# Altium project imx6ull_core.PrjPcb
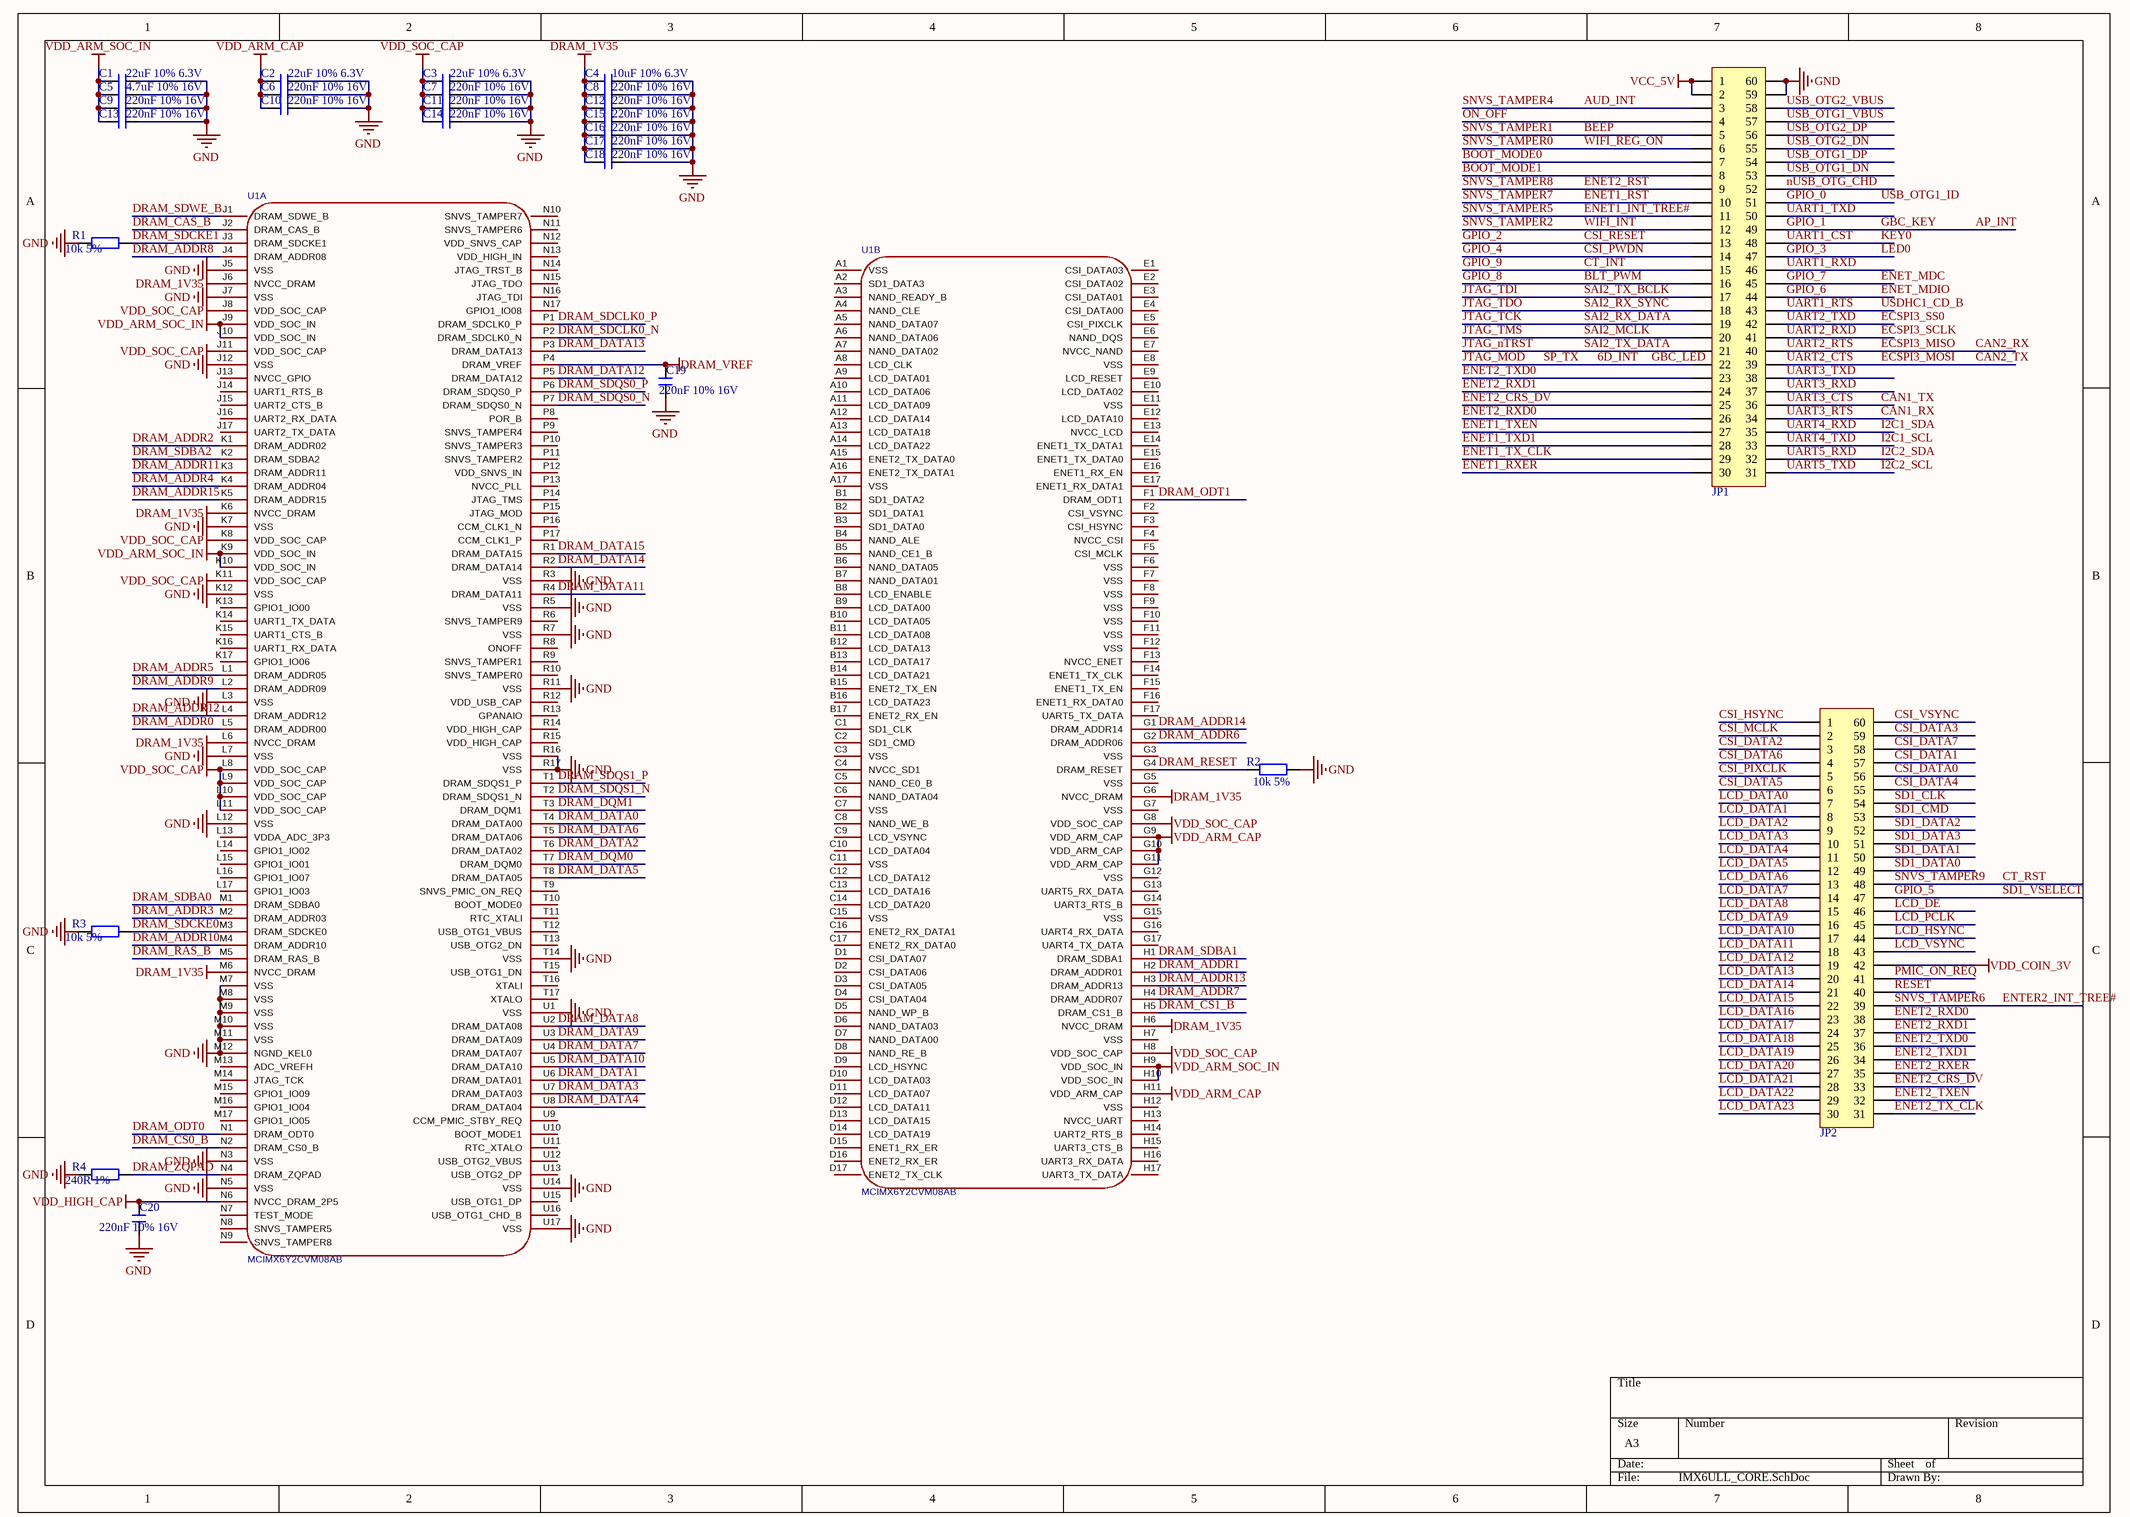
[diagram p0: IMX6ULL_CORE.SchDoc]
3 sheets, 92 parts. Net scope: global (net labels, ports and power ports of the same name join across sheets).
Sheets:
  IMX6ULL_CORE.SchDoc
  POWER.SchDoc
  DDR.SchDoc

## Sheet IMX6ULL_CORE.SchDoc
size A3; SheetNumber: 1; SheetTotal: 3

### Parts
C1  22uF 10% 6.3V  [C0603_L]
C2  22uF 10% 6.3V  [C0603_L]
C3  22uF 10% 6.3V  [C0603_L]
C4  10uF 10% 6.3V  [C0603_L]
C5  4.7uF 10% 16V  [C0603_L]
C6  220nF 10% 16V  [C0603_L]
C7  220nF 10% 16V  [C0603_L]
C8  220nF 10% 16V  [C0603_L]
C9  220nF 10% 16V  [C0603_L]
C10  220nF 10% 16V  [C0603_L]
C11  220nF 10% 16V  [C0603_L]
C12  220nF 10% 16V  [C0603_L]
C13  220nF 10% 16V  [C0603_L]
C14  220nF 10% 16V  [C0603_L]
C15  220nF 10% 16V  [C0603_L]
C16  220nF 10% 16V  [C0603_L]
C17  220nF 10% 16V  [C0603_L]
C18  220nF 10% 16V  [C0603_L]
C19  220nF 10% 16V  [C0603_L]
C20  220nF 10% 16V  [C0603_L]
JP1  Header 2X30  [IDC2.54-LI-2x30P]  (value not drawn)
JP2  Header 2X30  [IDC2.54-LI-2x30P]  (value not drawn)
R1  10k 5%  [R0603_L]
R2  10k 5%  [R0603_L]
R3  10k 5%  [R0603_L]
R4  240R 1%  [R0603_L]
U1  MCIMX6Y2CVM08AB  [BGA-289_L14.0-W14.0-R17-C17-P0.80-BL]  (parts A,B of 2)

### Nets
DRAM_1V35: C4.1 C8.1 C12.1 C15.1 C16.1 C17.1 C18.1 U1.G6(NVCC_DRAM) U1.H6(NVCC_DRAM) U1.J6(NVCC_DRAM) U1.K6(NVCC_DRAM) U1.L6(NVCC_DRAM) U1.M6(NVCC_DRAM)
DRAM_VREF: C19.2 U1.P4(DRAM_VREF)
GND: C1.2 C2.2 C3.2 C4.2 C5.2 C6.2 C7.2 C8.2 C9.2 C10.2 C11.2 C12.2 C13.2 C14.2 C15.2 C16.2 C17.2 C18.2 C19.1 C20.1 JP1.59 JP1.60 R1.1 R2.2 R3.1 R4.1 U1.J5(VSS) U1.J7(VSS) U1.J12(VSS) U1.K7(VSS) U1.K12(VSS) U1.L3(VSS) U1.L7(VSS) U1.L12(VSS) U1.M7(VSS) U1.M8(VSS) U1.M9(VSS) U1.M10(VSS) U1.M11(VSS) U1.M12(NGND_KEL0) U1.N3(VSS) U1.N5(VSS) U1.R3(VSS) U1.R5(VSS) U1.R7(VSS) U1.R11(VSS) U1.R16(VSS) U1.R17(VSS) U1.T14(VSS) U1.U1(VSS) U1.U14(VSS) U1.U17(VSS)
VCC_5V: JP1.1 JP1.2
VDD_ARM_CAP: C2.1 C6.1 C10.1 U1.G9(VDD_ARM_CAP) U1.G10(VDD_ARM_CAP) U1.G11(VDD_ARM_CAP) U1.H11(VDD_ARM_CAP)
VDD_ARM_SOC_IN: C1.1 C5.1 C9.1 C13.1 U1.H9(VDD_SOC_IN) U1.H10(VDD_SOC_IN) U1.J9(VDD_SOC_IN) U1.J10(VDD_SOC_IN) U1.K9(VDD_SOC_IN) U1.K10(VDD_SOC_IN)
VDD_COIN_3V: JP2.42
VDD_HIGH_CAP: C20.2 U1.N6(NVCC_DRAM_2P5)
VDD_SOC_CAP: C3.1 C7.1 C11.1 C14.1 U1.G8(VDD_SOC_CAP) U1.H8(VDD_SOC_CAP) U1.J8(VDD_SOC_CAP) U1.J11(VDD_SOC_CAP) U1.K8(VDD_SOC_CAP) U1.K11(VDD_SOC_CAP) U1.L8(VDD_SOC_CAP) U1.L9(VDD_SOC_CAP) U1.L10(VDD_SOC_CAP) U1.L11(VDD_SOC_CAP)
6D_INT: JP1.22  [also labelled GBC_LED, JTAG_MOD, SP_TX]
AP_INT: JP1.49  [also labelled GBC_KEY, GPIO_1]
AUD_INT: JP1.3  [also labelled SNVS_TAMPER4]
BEEP: JP1.5  [also labelled SNVS_TAMPER1]
BLT_PWM: JP1.16  [also labelled GPIO_8]
BOOT_MODE0: JP1.7
BOOT_MODE1: JP1.8
CAN1_RX: JP1.34  [also labelled UART3_RTS]
CAN1_TX: JP1.36  [also labelled UART3_CTS]
CAN2_RX: JP1.40  [also labelled ECSPI3_MISO, UART2_RTS]
CAN2_TX: JP1.39  [also labelled ECSPI3_MOSI, UART2_CTS]
CSI_DATA0: JP2.56
CSI_DATA1: JP2.57
CSI_DATA2: JP2.3
CSI_DATA3: JP2.59
CSI_DATA4: JP2.55
CSI_DATA5: JP2.6
CSI_DATA6: JP2.4
CSI_DATA7: JP2.58
CSI_HSYNC: JP2.1
CSI_MCLK: JP2.2
CSI_PIXCLK: JP2.5
CSI_PWDN: JP1.14  [also labelled GPIO_4]
CSI_RESET: JP1.13  [also labelled GPIO_2]
CSI_VSYNC: JP2.60
CT_INT: JP1.15  [also labelled GPIO_9]
CT_RST: JP2.48  [also labelled SNVS_TAMPER9]
DRAM_ADDR0: U1.L5(DRAM_ADDR00)
DRAM_ADDR1: U1.H2(DRAM_ADDR01)
DRAM_ADDR2: U1.K1(DRAM_ADDR02)
DRAM_ADDR3: U1.M2(DRAM_ADDR03)
DRAM_ADDR4: U1.K4(DRAM_ADDR04)
DRAM_ADDR5: U1.L1(DRAM_ADDR05)
DRAM_ADDR6: U1.G2(DRAM_ADDR06)
DRAM_ADDR7: U1.H4(DRAM_ADDR07)
DRAM_ADDR8: U1.J4(DRAM_ADDR08)
DRAM_ADDR9: U1.L2(DRAM_ADDR09)
DRAM_ADDR10: U1.M4(DRAM_ADDR10)
DRAM_ADDR11: U1.K3(DRAM_ADDR11)
DRAM_ADDR12: U1.L4(DRAM_ADDR12)
DRAM_ADDR13: U1.H3(DRAM_ADDR13)
DRAM_ADDR14: U1.G1(DRAM_ADDR14)
DRAM_ADDR15: U1.K5(DRAM_ADDR15)
DRAM_CAS_B: U1.J2(DRAM_CAS_B)
DRAM_CS0_B: U1.N2(DRAM_CS0_B)
DRAM_CS1_B: U1.H5(DRAM_CS1_B)
DRAM_DATA0: U1.T4(DRAM_DATA00)
DRAM_DATA1: U1.U6(DRAM_DATA01)
DRAM_DATA2: U1.T6(DRAM_DATA02)
DRAM_DATA3: U1.U7(DRAM_DATA03)
DRAM_DATA4: U1.U8(DRAM_DATA04)
DRAM_DATA5: U1.T8(DRAM_DATA05)
DRAM_DATA6: U1.T5(DRAM_DATA06)
DRAM_DATA7: U1.U4(DRAM_DATA07)
DRAM_DATA8: U1.U2(DRAM_DATA08)
DRAM_DATA9: U1.U3(DRAM_DATA09)
DRAM_DATA10: U1.U5(DRAM_DATA10)
DRAM_DATA11: U1.R4(DRAM_DATA11)
DRAM_DATA12: U1.P5(DRAM_DATA12)
DRAM_DATA13: U1.P3(DRAM_DATA13)
DRAM_DATA14: U1.R2(DRAM_DATA14)
DRAM_DATA15: U1.R1(DRAM_DATA15)
DRAM_DQM0: U1.T7(DRAM_DQM0)
DRAM_DQM1: U1.T3(DRAM_DQM1)
DRAM_ODT0: U1.N1(DRAM_ODT0)
DRAM_ODT1: U1.F1(DRAM_ODT1)
DRAM_RAS_B: U1.M5(DRAM_RAS_B)
DRAM_RESET: R2.1 U1.G4(DRAM_RESET)
DRAM_SDBA0: U1.M1(DRAM_SDBA0)
DRAM_SDBA1: U1.H1(DRAM_SDBA1)
DRAM_SDBA2: U1.K2(DRAM_SDBA2)
DRAM_SDCKE0: R3.2 U1.M3(DRAM_SDCKE0)
DRAM_SDCKE1: R1.2 U1.J3(DRAM_SDCKE1)
DRAM_SDCLK0_N: U1.P2(DRAM_SDCLK0_N)
DRAM_SDCLK0_P: U1.P1(DRAM_SDCLK0_P)
DRAM_SDQS0_N: U1.P7(DRAM_SDQS0_N)
DRAM_SDQS0_P: U1.P6(DRAM_SDQS0_P)
DRAM_SDQS1_N: U1.T2(DRAM_SDQS1_N)
DRAM_SDQS1_P: U1.T1(DRAM_SDQS1_P)
DRAM_SDWE_B: U1.J1(DRAM_SDWE_B)
DRAM_ZQPAD: R4.2 U1.N4(DRAM_ZQPAD)
ECSPI3_SCLK: JP1.41  [also labelled UART2_RXD]
ECSPI3_SS0: JP1.42  [also labelled UART2_TXD]
ENET1_INT_TREE#: JP1.11  [also labelled SNVS_TAMPER5]
ENET1_RST: JP1.10  [also labelled SNVS_TAMPER7]
ENET1_RXER: JP1.30
ENET1_TX_CLK: JP1.29
ENET1_TXD1: JP1.28
ENET1_TXEN: JP1.27
ENET2_CRS_DV: JP1.25 JP2.33
ENET2_RST: JP1.9  [also labelled SNVS_TAMPER8]
ENET2_RXD0: JP1.26 JP2.38
ENET2_RXD1: JP1.24 JP2.37
ENET2_RXER: JP2.35
ENET2_TX_CLK: JP2.31
ENET2_TXD0: JP1.23 JP2.36
ENET2_TXD1: JP2.34
ENET2_TXEN: JP2.32
ENET_MDC: JP1.45  [also labelled GPIO_7]
ENET_MDIO: JP1.44  [also labelled GPIO_6]
ENTER2_INT_TREE#: JP2.39  [also labelled SNVS_TAMPER6]
GPIO_0: JP1.51  [also labelled USB_OTG1_ID]
GPIO_3: JP1.47  [also labelled LED0]
GPIO_5: JP2.47  [also labelled SD1_VSELECT]
I2C1_SCL: JP1.33  [also labelled UART4_TXD]
I2C1_SDA: JP1.35  [also labelled UART4_RXD]
I2C2_SCL: JP1.31  [also labelled UART5_TXD]
I2C2_SDA: JP1.32  [also labelled UART5_RXD]
JTAG_nTRST: JP1.21  [also labelled SAI2_TX_DATA]
JTAG_TCK: JP1.19  [also labelled SAI2_RX_DATA]
JTAG_TDI: JP1.17  [also labelled SAI2_TX_BCLK]
JTAG_TDO: JP1.18  [also labelled SAI2_RX_SYNC]
JTAG_TMS: JP1.20  [also labelled SAI2_MCLK]
KEY0: JP1.48  [also labelled UART1_CST]
LCD_DATA0: JP2.7
LCD_DATA1: JP2.8
LCD_DATA2: JP2.9
LCD_DATA3: JP2.10
LCD_DATA4: JP2.11
LCD_DATA5: JP2.12
LCD_DATA6: JP2.13
LCD_DATA7: JP2.14
LCD_DATA8: JP2.15
LCD_DATA9: JP2.16
LCD_DATA10: JP2.17
LCD_DATA11: JP2.18
LCD_DATA12: JP2.19
LCD_DATA13: JP2.20
LCD_DATA14: JP2.21
LCD_DATA15: JP2.22
LCD_DATA16: JP2.23
LCD_DATA17: JP2.24
LCD_DATA18: JP2.25
LCD_DATA19: JP2.26
LCD_DATA20: JP2.27
LCD_DATA21: JP2.28
LCD_DATA22: JP2.29
LCD_DATA23: JP2.30
LCD_DE: JP2.46
LCD_HSYNC: JP2.44
LCD_PCLK: JP2.45
LCD_VSYNC: JP2.43
nUSB_OTG_CHD: JP1.52
ON_OFF: JP1.4
PMIC_ON_REQ: JP2.41
RESET: JP2.40
SD1_CLK: JP2.54
SD1_CMD: JP2.53
SD1_DATA0: JP2.49
SD1_DATA1: JP2.50
SD1_DATA2: JP2.52
SD1_DATA3: JP2.51
SNVS_TAMPER0: JP1.6  [also labelled WIFI_REG_ON]
SNVS_TAMPER2: JP1.12  [also labelled WIFI_INT]
UART1_RTS: JP1.43  [also labelled USDHC1_CD_B]
UART1_RXD: JP1.46
UART1_TXD: JP1.50
UART3_RXD: JP1.37
UART3_TXD: JP1.38
USB_OTG1_DN: JP1.53
USB_OTG1_DP: JP1.54
USB_OTG1_VBUS: JP1.57
USB_OTG2_DN: JP1.55
USB_OTG2_DP: JP1.56
USB_OTG2_VBUS: JP1.58

Not connected (* = marked no-connect by the designer): U1 A1(VSS) A2(SD1_DATA3) A3(NAND_READY_B) A4(NAND_CLE) A5(NAND_DATA07) A6(NAND_DATA06) A7(NAND_DATA02) A8(LCD_CLK) A9(LCD_DATA01) A10(LCD_DATA06) A11(LCD_DATA09) A12(LCD_DATA14) A13(LCD_DATA18) A14(LCD_DATA22) A15(ENET2_TX_DATA0) A16(ENET2_TX_DATA1) A17(VSS) B1(SD1_DATA2) B2(SD1_DATA1) B3(SD1_DATA0) B4(NAND_ALE) B5(NAND_CE1_B) B6(NAND_DATA05) B7(NAND_DATA01) B8(LCD_ENABLE) B9(LCD_DATA00) B10(LCD_DATA05) B11(LCD_DATA08) B12(LCD_DATA13) B13(LCD_DATA17) B14(LCD_DATA21) B15(ENET2_TX_EN) B16(LCD_DATA23) B17(ENET2_RX_EN) C1(SD1_CLK) C2(SD1_CMD) C3(VSS) C4(NVCC_SD1) C5(NAND_CE0_B) C6(NAND_DATA04) C7(VSS) C8(NAND_WE_B) C9(LCD_VSYNC) C10(LCD_DATA04) C11(VSS) C12(LCD_DATA12) C13(LCD_DATA16) C14(LCD_DATA20) C15(VSS) C16(ENET2_RX_DATA1) C17(ENET2_RX_DATA0) D1(CSI_DATA07) D2(CSI_DATA06) D3(CSI_DATA05) D4(CSI_DATA04) D5(NAND_WP_B) D6(NAND_DATA03) D7(NAND_DATA00) D8(NAND_RE_B) D9(LCD_HSYNC) D10(LCD_DATA03) D11(LCD_DATA07) D12(LCD_DATA11) D13(LCD_DATA15) D14(LCD_DATA19) D15(ENET1_RX_ER) D16(ENET2_RX_ER) D17(ENET2_TX_CLK) E1(CSI_DATA03) E2(CSI_DATA02) E3(CSI_DATA01) E4(CSI_DATA00) E5(CSI_PIXCLK) E6(NAND_DQS) E7(NVCC_NAND) E8(VSS) E9(LCD_RESET) E10(LCD_DATA02) E11(VSS) E12(LCD_DATA10) E13(NVCC_LCD) E14(ENET1_TX_DATA1) E15(ENET1_TX_DATA0) E16(ENET1_RX_EN) E17(ENET1_RX_DATA1) F2(CSI_VSYNC) F3(CSI_HSYNC) F4(NVCC_CSI) F5(CSI_MCLK) F6(VSS) F7(VSS) F8(VSS) F9(VSS) F10(VSS) F11(VSS) F12(VSS) F13(NVCC_ENET) F14(ENET1_TX_CLK) F15(ENET1_TX_EN) F16(ENET1_RX_DATA0) F17(UART5_TX_DATA) G3(VSS) G5(VSS) G7(VSS) G12(VSS) G13(UART5_RX_DATA) G14(UART3_RTS_B) G15(VSS) G16(UART4_RX_DATA) G17(UART4_TX_DATA) H7(VSS) H12(VSS) H13(NVCC_UART) H14(UART2_RTS_B) H15(UART3_CTS_B) H16(UART3_RX_DATA) H17(UART3_TX_DATA) J13(NVCC_GPIO) J14(UART1_RTS_B) J15(UART2_CTS_B) J16(UART2_RX_DATA) J17(UART2_TX_DATA) K13(GPIO1_IO00) K14(UART1_TX_DATA) K15(UART1_CTS_B) K16(UART1_RX_DATA) K17(GPIO1_IO06) L13(VDDA_ADC_3P3) L14(GPIO1_IO02) L15(GPIO1_IO01) L16(GPIO1_IO07) L17(GPIO1_IO03) M13(ADC_VREFH) M14(JTAG_TCK) M15(GPIO1_IO09) M16(GPIO1_IO04) M17(GPIO1_IO05) N7(TEST_MODE) N8(SNVS_TAMPER5) N9(SNVS_TAMPER8) N10(SNVS_TAMPER7) N11(SNVS_TAMPER6) N12(VDD_SNVS_CAP) N13(VDD_HIGH_IN) N14(JTAG_TRST_B) N15(JTAG_TDO) N16(JTAG_TDI) N17(GPIO1_IO08) P8(POR_B) P9(SNVS_TAMPER4) P10(SNVS_TAMPER3) P11(SNVS_TAMPER2) P12(VDD_SNVS_IN) P13(NVCC_PLL) P14(JTAG_TMS) P15(JTAG_MOD) P16(CCM_CLK1_N) P17(CCM_CLK1_P) R6(SNVS_TAMPER9) R8(ONOFF) R9(SNVS_TAMPER1) R10(SNVS_TAMPER0) R12(VDD_USB_CAP) R13(GPANAIO) R14(VDD_HIGH_CAP) R15(VDD_HIGH_CAP) T9(SNVS_PMIC_ON_REQ) T10(BOOT_MODE0) T11(RTC_XTALI) T12(USB_OTG1_VBUS) T13(USB_OTG2_DN) T15(USB_OTG1_DN) T16(XTALI) T17(XTALO) U9(CCM_PMIC_STBY_REQ) U10(BOOT_MODE1) U11(RTC_XTALO) U12(USB_OTG2_VBUS) U13(USB_OTG2_DP) U15(USB_OTG1_DP) U16(USB_OTG1_CHD_B)

### Library data of the parts
C1-C20 = C: 贴片电容; BOM名称: 无极性贴片电容; 优秀评价可免费更新: 联系淘宝ID：黄晶宝石，获取更新版封装库; 卖家免费技术支持，联系售后: 唯一出售店铺网址https://shop463601444.taobao.com; 本封装库来自淘宝卖家 ID：黄晶宝石: 其他店铺购入均为盗版，请立即申请退款
JP1 JP2 = Header 30X2: 30*2P接插件; BOM名称: 20*2P接插件; 联系卖家，免费查找封装: 唯一出售店铺网址https://shop463601444.taobao.com; 封装库来自淘宝卖家ID：黄晶宝石: 其他店铺购入均为盗版封装库，请立即申请退款，本店现金奖励50~200元
R1-R4 = R: 贴片电阻; 优秀评价可免费更新: 联系淘宝ID：黄晶宝石，获取更新版封装库; 卖家免费技术支持，联系售后: 唯一出售店铺网址https://shop463601444.taobao.com; 本封装库来自淘宝卖家 ID：黄晶宝石: 其他店铺购入均为盗版，请立即申请退款; BOM名称: 贴片电阻
U1 = MCIMX6Y2CVM08AB: CPU内核:ARM Cortex-A7;CPU最大主频:792MHz;CPU位数:32 Bit;; Manufacturer: NXP(恩智浦); Relevance: []; AddInBom: yes; ModelId: a5b4ce0fea5c4f8daaedcc161a7e0fdb聨0819f05c4eef4c71ace90d822a990e87; ModelName: BGA-289_L14.0-W14.0-H1.4-P0.8; ModelTransform: 551.18,551.18,0,90,0,0,1.403,1.408,0; CPU Maximum Speed: 792MHz; Core Size: 32 Bit; Program Storage Size: 128KB; ADC (Bit): 12bit; Voltage - Supply: 1.8V；2.8V；3.3V; Symbol: MCIMX6Y2CVM08AB; Device: MCIMX6Y2CVM08AB; FootprintName: BGA-289_L14.0-W14.0-R17-C17-P0.80-BL; LCSC Part Name: i.MX 6ULL 工业产品应用处理器; SupplierPart: C414042; ManufacturerPart: MCIMX6Y2CVM08AB; Supplier Footprint: MAPBGA-289(14x14); JLCPCB Part Class: Extended Part; Datasheet: https://www.nxp.com/docs/en/data-sheet/IMX6ULLIEC.pdf; Supplier: LCSC; ConvertToPcb: yes; CPU Core: ARM Cortex-A7; RAM Size: 128KB; Operating Temperature: -40℃~+105℃; Features: 窗口看门狗(WWDG)；独立看门狗(IWDG)；日历功能；上电复位(POR)；真随机数发生器(TRNG)；内置通用定时器；内置温度传感器；可编程看门狗；集成LDO

## Sheet POWER.SchDoc
size A4; SheetNumber: 2; SheetTotal: 3
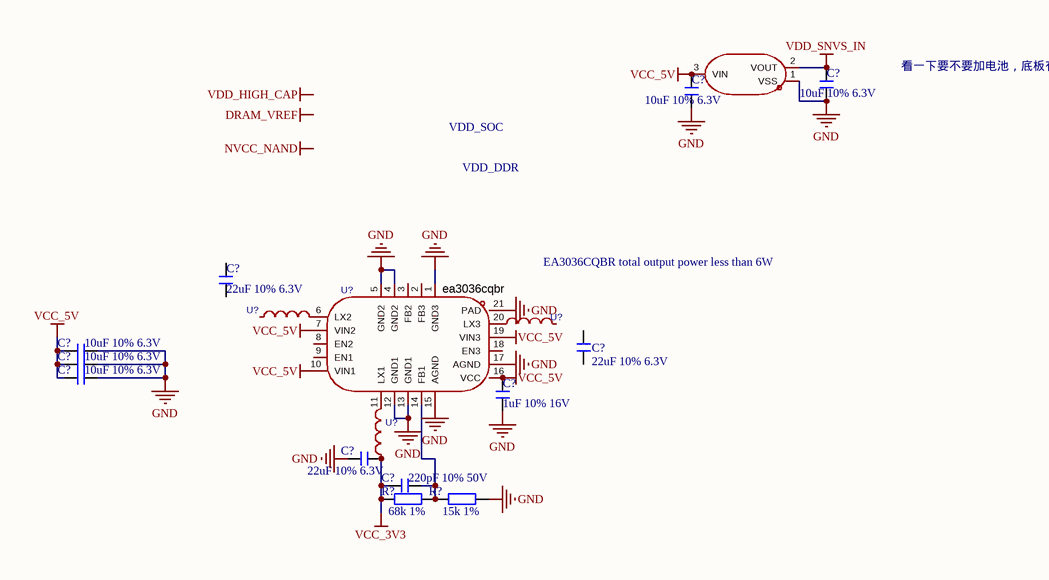
[diagram p1: POWER.SchDoc]

### Parts
(Parts that share a designator on the sheet are numbered #1, #2 ... from top to bottom, then left to right.)
C?#1  10uF 10% 6.3V  [C0402_L]
C?#2  10uF 10% 6.3V  [C0402_L]
C?#3  22uF 10% 6.3V  [C0603_L]
C?#4  22uF 10% 6.3V  [C0603_L]
C?#5  10uF 10% 6.3V  [C0603_L]
C?#6  10uF 10% 6.3V  [C0603_L]
C?#7  10uF 10% 6.3V  [C0603_L]
C?#8  1uF 10% 16V  [C0603_L]
C?#9  22uF 10% 6.3V  [C0603_L]
C?#10  220pF 10% 50V  [C0603_L]
R?#1  68k 1%  [R0603_L]
R?#2  15k 1%  [R0603_L]
U?#1  662k.  [SOT-23-3_L2.9-W1.3-P1.90-LS2.4-BR]  (value not drawn)
U?#2  mwtc252010s2r2mt  [IND-SMD_L2.5-W2.0_AHP252010X]  (value not drawn)
U?#3  mwtc252010s2r2mt  [IND-SMD_L2.5-W2.0_AHP252010X]  (value not drawn)
U?#4  ea3036cqbr  [WQFN-20_L3.0-W3.0-P0.40-BL-EP]
U?#5  mwtc252010s2r2mt  [IND-SMD_L2.5-W2.0_AHP252010X]  (value not drawn)

### Nets
GND: C?#1.1 C?#2.1 C?#5.1 C?#6.1 C?#7.1 C?#8.1 C?#9.1 R?#2.1 U?#1.1(VSS) U?#4.1(GND3) U?#4.4(GND2) U?#4.5(GND2) U?#4.12(GND1) U?#4.13(GND1) U?#4.15(AGND) U?#4.17(AGND) U?#4.21(PAD)
VCC_3V3: C?#9.2 C?#10.1 R?#1.2 U?#5.1
VCC_5V: C?#2.2 C?#5.2 C?#6.2 C?#7.2 C?#8.2 U?#1.3(VIN) U?#4.7(VIN2) U?#4.10(VIN1) U?#4.16(VCC) U?#4.19(VIN3)
VDD_SNVS_IN: C?#1.2 U?#1.2(VOUT)
NetC?#10_2: C?#10.2 R?#1.1 R?#2.2 U?#4.14(FB1)
NetU?#2_2: U?#2.2 U?#4.6(LX2)
NetU?#3_1: U?#3.1 U?#4.20(LX3)
NetU?#4_11: U?#4.11(LX1) U?#5.2

Not connected (* = marked no-connect by the designer): C?#3 1 2; C?#4 1 2; U?#2 1; U?#3 2; U?#4 2(FB3) 3(FB2) 8(EN2) 9(EN1) 18(EN3)

### Notes on the sheet
- 看一下要不要加电池，底板有咩有时钟芯片
- VDD_SOC
- VDD_DDR
- EA3036CQBR total output power less than 6W
- Labels drawn without touching a wire or pin: DRAM_VREF, NVCC_NAND, VDD_HIGH_CAP

### Library data of the parts
C?#1-C?#10 = C: as C1 on sheet IMX6ULL_CORE
R?#1 R?#2 = R: as R1 on sheet IMX6ULL_CORE; BOM名称: 贴片电阻
U?#1 = 662k.: 输出极性:正极;工作电压:6V;输出电压:3.3V;输出电流:300mA;电源纹波抑制比(PSRR):-;输出类型:固定;; Manufacturer: FM(富满); AddInBom: yes; ModelId: c62791f0466c4ae2a892c056b845b0ca; ModelName: SOT-23-3P_L2.9-W1.3-H1.0-LS2.4-P0.95; ModelTransform: 98.425,114.173,0,180,0,0,0.0005,-0.0005,0; Output Configuration: 正极; Voltage - Supply: 6V; Output Voltage: 3.3V; Output Current: 300mA; Voltage Dropout: 40mV@(30mA); standby current: 10uA; Output Type: 固定; Number of Outputs: 1; Symbol: 662K.; LCSC Part Name: 3.3V 300mA 6V; SupplierPart: C841298; ManufacturerPart: 662K.; Supplier Footprint: SOT-23-3; JLCPCB Part Class: Extended Part; Datasheet: https://item.szlcsc.com/datasheet/662K./898173.html; Supplier: LCSC; ConvertToPcb: yes; FootprintName: SOT-23-3_L2.9-W1.3-P1.90-LS2.4-BR; Power Supply Rejection Ratio (PSRR): -; Noise: -; Features: 短路保护; Operating Temperature: -40℃~+130℃@(Tj)
U?#2 U?#3 U?#5 = mwtc252010s2r2mt: 特性：铁合金材料,高通流,低损耗。黑胶热喷,表面致密性更好。闭合磁路设计,漏磁干扰小。应用：智能手机、平板。笔记本电脑、虚拟现实、增强现实; Manufacturer: Sunlord(顺络); AddInBom: yes; ModelId: 367fe49331814287ace6cad199df558f; ModelName: IND-SMD_L2.5-W2.0-H1.2_AHP252010X; ModelTransform: 78.74,98.425,0,90,0,0,0,0,0; Symbol: MWTC252010S2R2MT; LCSC Part Name: 2.2uH ±20%; SupplierPart: C5151938; ManufacturerPart: MWTC252010S2R2MT; Supplier Footprint: 1008; JLCPCB Part Class: Extended Part; Datasheet: https://item.szlcsc.com/datasheet/MWTC252010S2R2MT/5778351.html; Supplier: LCSC; ConvertToPcb: yes; FootprintName: IND-SMD_L2.5-W2.0_AHP252010X
U?#4 = ea3036cqbr: EA3036C是一款适用于单节锂离子电池或5V直流适配器供电应用的3通道电源管理IC。集成了三个同步降压转换器，可在轻载和重载运行时提供高效率输出。其内部补偿架构简化了应用电路设计。此外，独立的使能控使设计人员能够最大程度地灵活优化电源排序的时序。EA3036C采用20引脚3x3 QFN封装。; Manufacturer: everanalog(申风); AddInBom: yes; ModelId: 9d0d463ce51e4a5d8b410cb10c323c6d; ModelName: WQFN-20_L3.0-W3.0-H0.8-P0.40; ModelTransform: 118.8974,118.8974,0,0,0,0,0,0.005,0; Input Voltage: 2.7V~5.5V; Output Voltage: 0.6V；5.5V; Output Current: 1.2A；1.5A；1.2A; Symbol: EA3036C; LCSC Part Name: 三路电源管理IC; SupplierPart: C570857; ManufacturerPart: EA3036CQBR; Supplier Footprint: WQFN-20-EP(3x3); JLCPCB Part Class: Extended Part; Datasheet: https://item.szlcsc.com/datasheet/EA3036CQBR/596623.html; Supplier: LCSC; ConvertToPcb: yes; FootprintName: WQFN-20_L3.0-W3.0-P0.40-BL-EP; Features: 上电时序控制；逐波限流；轻载高效模式; Interface: -; Operating Temperature: -40℃~+125℃

## Sheet DDR.SchDoc
size A4; SheetNumber: 3; SheetTotal: 3
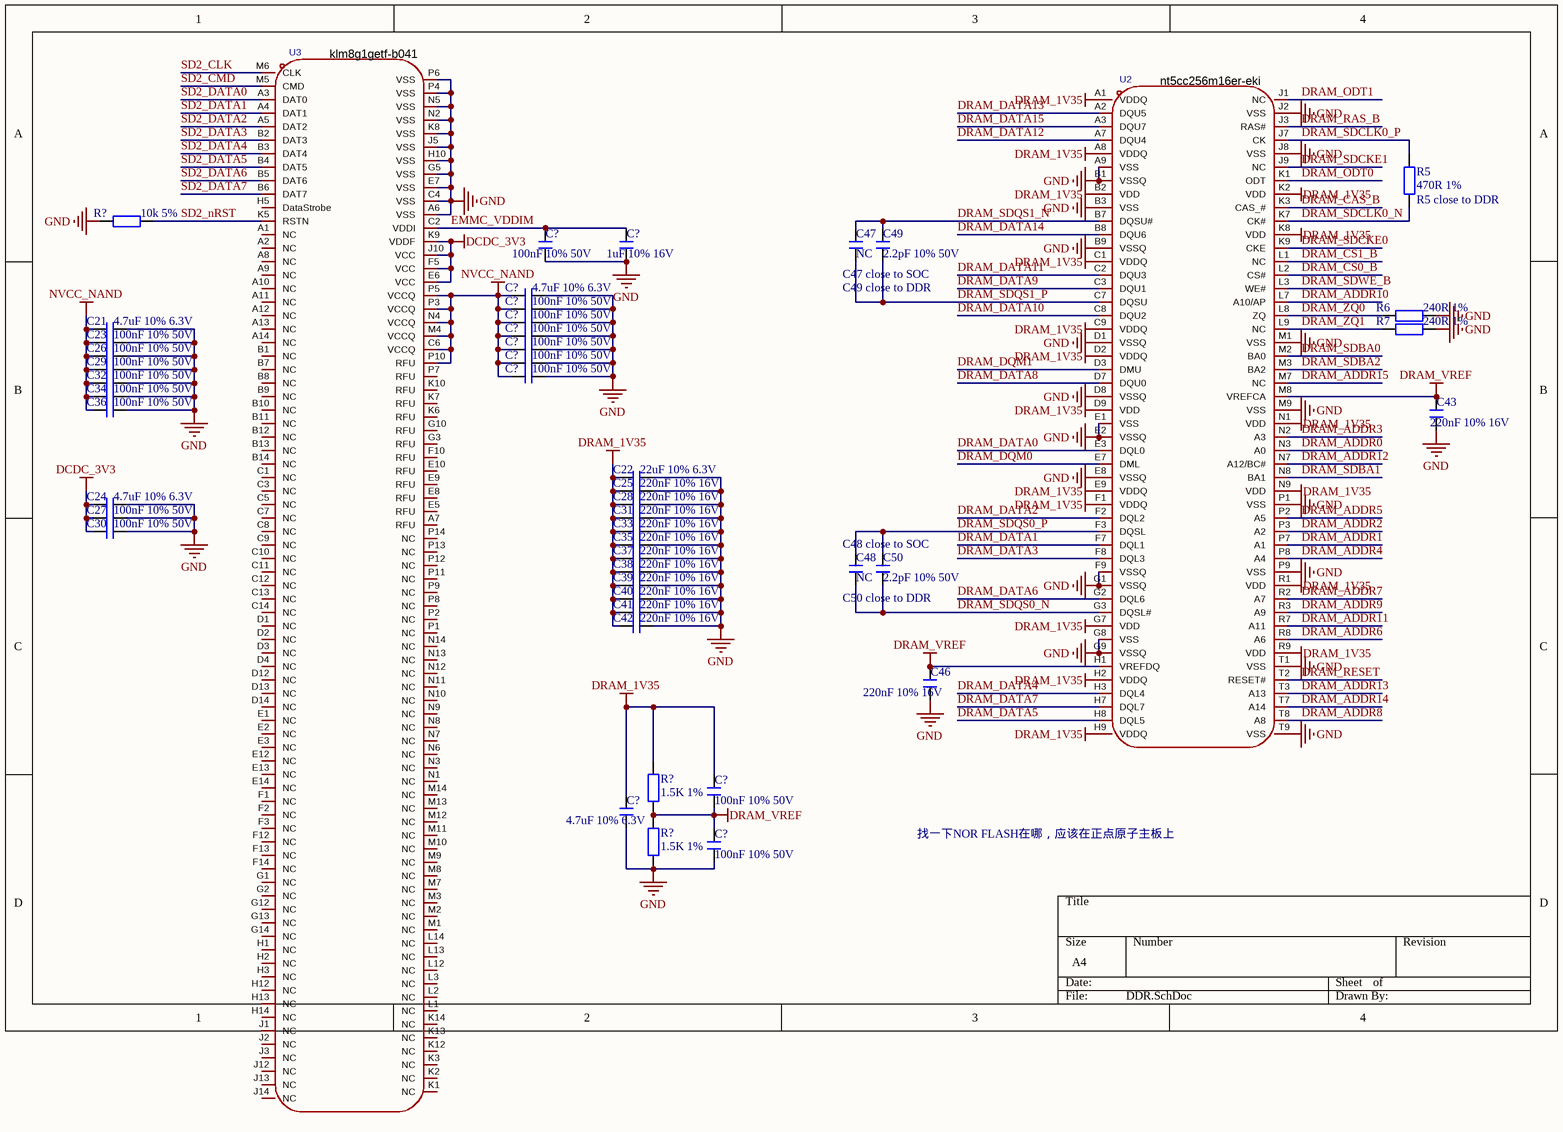
[diagram p2: DDR.SchDoc]

### Parts
(Parts that share a designator on the sheet are numbered #1, #2 ... from top to bottom, then left to right.)
C21  4.7uF 10% 6.3V  [C0603_L]
C22  22uF 10% 6.3V  [C0603_L]
C23  100nF 10% 50V  [C0603_L]
C24  4.7uF 10% 6.3V  [C0603_L]
C25  220nF 10% 16V  [C0603_L]
C26  100nF 10% 50V  [C0603_L]
C27  100nF 10% 50V  [C0603_L]
C28  220nF 10% 16V  [C0603_L]
C29  100nF 10% 50V  [C0603_L]
C30  100nF 10% 50V  [C0603_L]
C31  220nF 10% 16V  [C0603_L]
C32  100nF 10% 50V  [C0603_L]
C33  220nF 10% 16V  [C0603_L]
C34  100nF 10% 50V  [C0603_L]
C35  220nF 10% 16V  [C0603_L]
C36  100nF 10% 50V  [C0603_L]
C37  220nF 10% 16V  [C0603_L]
C38  220nF 10% 16V  [C0603_L]
C39  220nF 10% 16V  [C0603_L]
C40  220nF 10% 16V  [C0603_L]
C41  220nF 10% 16V  [C0603_L]
C42  220nF 10% 16V  [C0603_L]
C43  220nF 10% 16V  [C0603_L]
C46  220nF 10% 16V  [C0603_L]
C47  NC  [C0603_L]
C48  NC  [C0603_L]
C49  2.2pF 10% 50V  [C0603_L]
C50  2.2pF 10% 50V  [C0603_L]
C?#11  1uF 10% 16V  [C0603_L]
C?#12  100nF 10% 50V  [C0603_L]
C?#13  4.7uF 10% 6.3V  [C0603_L]
C?#14  100nF 10% 50V  [C0603_L]
C?#15  100nF 10% 50V  [C0603_L]
C?#16  100nF 10% 50V  [C0603_L]
C?#17  100nF 10% 50V  [C0603_L]
C?#18  100nF 10% 50V  [C0603_L]
C?#19  100nF 10% 50V  [C0603_L]
C?#20  100nF 10% 50V  [C0603_L]
C?#21  4.7uF 10% 6.3V  [C0603_L]
C?#22  100nF 10% 50V  [C0603_L]
R5  470R 1%  [R0603_L]
R6  240R 1%  [R0603_L]
R7  240R 1%  [R0603_L]
R?#3  10k 5%  [R0603_L]
R?#4  1.5K 1%  [R0603_L]
R?#5  1.5K 1%  [R0603_L]
U2  nt5cc256m16er-eki  [TFBGA-96_L13.0-W8.0-R16-C6-P0.80-TL]
U3  klm8g1getf-b041  [FBGA-153_L13.0-W11.5-P0.50_KLMAG1JETD-B041]

### Nets
DCDC_3V3: C24.1 C27.1 C30.1 U3.E6(VCC) U3.F5(VCC) U3.J10(VCC) U3.K9(VDDF)
DRAM_1V35: C22.1 C25.1 C28.1 C31.1 C33.1 C35.1 C37.1 C38.1 C39.1 C40.1 C41.1 C42.1 C?#20.2 C?#21.2 R?#4.2 U2.A1(VDDQ) U2.A8(VDDQ) U2.B2(VDD) U2.C1(VDDQ) U2.C9(VDDQ) U2.D2(VDDQ) U2.D9(VDD) U2.E9(VDDQ) U2.F1(VDDQ) U2.G7(VDD) U2.H2(VDDQ) U2.H9(VDDQ) U2.K2(VDD) U2.K8(VDD) U2.N1(VDD) U2.N9(VDD) U2.R1(VDD) U2.R9(VDD)
DRAM_VREF: C43.2 C46.2 C?#20.1 C?#22.2 R?#4.1 R?#5.2 U2.H1(VREFDQ) U2.M8(VREFCA)
GND: C21.2 C22.2 C23.2 C24.2 C25.2 C26.2 C27.2 C28.2 C29.2 C30.2 C31.2 C32.2 C33.2 C34.2 C35.2 C36.2 C37.2 C38.2 C39.2 C40.2 C41.2 C42.2 C43.1 C46.1 C?#11.2 C?#12.1 C?#13.2 C?#14.1 C?#15.1 C?#16.1 C?#17.1 C?#18.1 C?#19.1 C?#21.1 C?#22.1 R6.2 R7.2 R?#3.1 R?#5.1 U2.A9(VSS) U2.B1(VSSQ) U2.B3(VSS) U2.B9(VSSQ) U2.D1(VSSQ) U2.D8(VSSQ) U2.E1(VSS) U2.E2(VSSQ) U2.E8(VSSQ) U2.F9(VSSQ) U2.G1(VSSQ) U2.G8(VSS) U2.G9(VSSQ) U2.J2(VSS) U2.J8(VSS) U2.M1(VSS) U2.M9(VSS) U2.P1(VSS) U2.P9(VSS) U2.T1(VSS) U2.T9(VSS) U3.A6(VSS) U3.C4(VSS) U3.E7(VSS) U3.G5(VSS) U3.H10(VSS) U3.J5(VSS) U3.K8(VSS) U3.N2(VSS) U3.N5(VSS) U3.P4(VSS) U3.P6(VSS)
NVCC_NAND: C21.1 C23.1 C26.1 C29.1 C32.1 C34.1 C36.1 C?#13.1 C?#14.2 C?#15.2 C?#16.2 C?#17.2 C?#18.2 C?#19.2 U3.C6(VCCQ) U3.M4(VCCQ) U3.N4(VCCQ) U3.P3(VCCQ) U3.P5(VCCQ) U3.P10(RFU)
DRAM_ADDR0: U2.N3(A0)
DRAM_ADDR1: U2.P7(A1)
DRAM_ADDR2: U2.P3(A2)
DRAM_ADDR3: U2.N2(A3)
DRAM_ADDR4: U2.P8(A4)
DRAM_ADDR5: U2.P2(A5)
DRAM_ADDR6: U2.R8(A6)
DRAM_ADDR7: U2.R2(A7)
DRAM_ADDR8: U2.T8(A8)
DRAM_ADDR9: U2.R3(A9)
DRAM_ADDR10: U2.L7(A10/AP)
DRAM_ADDR11: U2.R7(A11)
DRAM_ADDR12: U2.N7(A12/BC#)
DRAM_ADDR13: U2.T3(A13)
DRAM_ADDR14: U2.T7(A14)
DRAM_ADDR15: U2.M7(NC)
DRAM_CAS_B: U2.K3(CAS_#)
DRAM_CS0_B: U2.L2(CS#)
DRAM_CS1_B: U2.L1(NC)
DRAM_DATA0: U2.E3(DQL0)
DRAM_DATA1: U2.F7(DQL1)
DRAM_DATA2: U2.F2(DQL2)
DRAM_DATA3: U2.F8(DQL3)
DRAM_DATA4: U2.H3(DQL4)
DRAM_DATA5: U2.H8(DQL5)
DRAM_DATA6: U2.G2(DQL6)
DRAM_DATA7: U2.H7(DQL7)
DRAM_DATA8: U2.D7(DQU0)
DRAM_DATA9: U2.C3(DQU1)
DRAM_DATA10: U2.C8(DQU2)
DRAM_DATA11: U2.C2(DQU3)
DRAM_DATA12: U2.A7(DQU4)
DRAM_DATA13: U2.A2(DQU5)
DRAM_DATA14: U2.B8(DQU6)
DRAM_DATA15: U2.A3(DQU7)
DRAM_DQM0: U2.E7(DML)
DRAM_DQM1: U2.D3(DMU)
DRAM_ODT0: U2.K1(ODT)
DRAM_ODT1: U2.J1(NC)
DRAM_RAS_B: U2.J3(RAS#)
DRAM_RESET: U2.T2(RESET#)
DRAM_SDBA0: U2.M2(BA0)
DRAM_SDBA1: U2.N8(BA1)
DRAM_SDBA2: U2.M3(BA2)
DRAM_SDCKE0: U2.K9(CKE)
DRAM_SDCKE1: U2.J9(NC)
DRAM_SDCLK0_N: R5.2 U2.K7(CK#)
DRAM_SDCLK0_P: R5.1 U2.J7(CK)
DRAM_SDQS0_N: C48.1 C50.1 U2.G3(DQSL#)
DRAM_SDQS0_P: C48.2 C50.2 U2.F3(DQSL)
DRAM_SDQS1_N: C47.2 C49.2 U2.B7(DQSU#)
DRAM_SDQS1_P: C47.1 C49.1 U2.C7(DQSU)
DRAM_SDWE_B: U2.L3(WE#)
DRAM_ZQ0: R6.1 U2.L8(ZQ)
DRAM_ZQ1: R7.1 U2.L9(NC)
EMMC_VDDIM: C?#11.1 C?#12.2 U3.C2(VDDI)
SD2_CLK: U3.M6(CLK)
SD2_CMD: U3.M5(CMD)
SD2_DATA0: U3.A3(DAT0)
SD2_DATA1: U3.A4(DAT1)
SD2_DATA2: U3.A5(DAT2)
SD2_DATA3: U3.B2(DAT3)
SD2_DATA4: U3.B3(DAT4)
SD2_DATA5: U3.B4(DAT5)
SD2_DATA6: U3.B5(DAT6)
SD2_DATA7: U3.B6(DAT7)
SD2_nRST: R?#3.2 U3.K5(RSTN)

Not connected (* = marked no-connect by the designer): U3 A1(NC) A2(NC) A7(RFU) A8(NC) A9(NC) A10(NC) A11(NC) A12(NC) A13(NC) A14(NC) B1(NC) B7(NC) B8(NC) B9(NC) B10(NC) B11(NC) B12(NC) B13(NC) B14(NC) C1(NC) C3(NC) C5(NC) C7(NC) C8(NC) C9(NC) C10(NC) C11(NC) C12(NC) C13(NC) C14(NC) D1(NC) D2(NC) D3(NC) D4(NC) D12(NC) D13(NC) D14(NC) E1(NC) E2(NC) E3(NC) E5(RFU) E8(RFU) E9(RFU) E10(RFU) E12(NC) E13(NC) E14(NC) F1(NC) F2(NC) F3(NC) F10(RFU) F12(NC) F13(NC) F14(NC) G1(NC) G2(NC) G3(RFU) G10(RFU) G12(NC) G13(NC) G14(NC) H1(NC) H2(NC) H3(NC) H5(DataStrobe) H12(NC) H13(NC) H14(NC) J1(NC) J2(NC) J3(NC) J12(NC) J13(NC) J14(NC) K1(NC) K2(NC) K3(NC) K6(RFU) K7(RFU) K10(RFU) K12(NC) K13(NC) K14(NC) L1(NC) L2(NC) L3(NC) L12(NC) L13(NC) L14(NC) M1(NC) M2(NC) M3(NC) M7(NC) M8(NC) M9(NC) M10(NC) M11(NC) M12(NC) M13(NC) M14(NC) N1(NC) N3(NC) N6(NC) N7(NC) N8(NC) N9(NC) N10(NC) N11(NC) N12(NC) N13(NC) N14(NC) P1(NC) P2(NC) P7(RFU) P8(NC) P9(NC) P11(NC) P12(NC) P13(NC) P14(NC)

### Notes on the sheet
- (near R5) R5 close to DDR
- C47 close to SOC
- C49 close to DDR
- C48 close to SOC
- C50 close to DDR
- 找一下NOR FLASH在哪，应该在正点原子主板上

### Library data of the parts
C21-C43 C46-C50 C?#11-C?#22 = C: as C1 on sheet IMX6ULL_CORE
R5-R7 R?#3-R?#5 = R: as R1 on sheet IMX6ULL_CORE; BOM名称: 贴片电阻
U2 = nt5cc256m16er-eki: 存储器构架(格式):DDR3L SDRAM;时钟频率(fc):933MHz;存储容量:4Gbit;; Manufacturer: Nanya(南亚科技); AddInBom: yes; ModelId: 0ec929e740a041138b079053a12b9d40; ModelName: TFBGA-96_L13.0-W8.0-H1.1-R16-C6-P0.80-TL; ModelTransform: 314.96,511.81,0,0,0,0,0.004,0.004,0; Clock Frequency: 933MHz; Memory Size: 4Gbit; Voltage - Supply: 1.5V；1.35V; Symbol: NT5CC256M16ER-EKI; LCSC Part Name: 商用和工业用DDR3(L) 4Gb SDRAM; SupplierPart: C2841153; ManufacturerPart: NT5CC256M16ER-EKI; Supplier Footprint: TFBGA-96; JLCPCB Part Class: Extended Part; Datasheet: https://item.szlcsc.com/datasheet/NT5CC256M16ER-EKI/3022849.html; Supplier: LCSC; ConvertToPcb: yes; FootprintName: TFBGA-96_L13.0-W8.0-R16-C6-P0.80-TL; Memory Format: DDR3L SDRAM; Current - Supply: -; Refresh Current: -; Operating Temperature: -40℃~+95℃; Features: 写入均衡功能；自动自刷新；自动预充电功能；ZQ校准功能；异步复位功能；动态片上端接
U3 = klm8g1getf-b041: NAND闪存类型:-;协议版本:eMMC 5.1;存储容量:8GB;; Manufacturer: SAMSUNG(三星半导体); AddInBom: yes; ModelId: e295469cf8df408b9f13391ad06a16e8; ModelName: FBGA-153_L13.0-W11.5-H1.1-P0.50_KLMAG1JETD-B041; ModelTransform: 452.755,511.81,0,0,0,0,0,0,0; Memory Size: 8GB; Reading Speed in Sequence: 330MB/S; Writing Speed in Sequence: 50MB/S; NAND Operating Voltage (VCCF): 2.7V~3.6V; Controller Operating Voltage (VCCQ): 2.7V~3.6V；1.7V~1.95V; Symbol: KLM8G1GETF-B041; LCSC Part Name: 嵌入式多媒体卡解决方案，采用BGA封装，兼容eMMC 5.1协议，支持HS400模式; SupplierPart: C499918; ManufacturerPart: KLM8G1GETF-B041; Supplier Footprint: FBGA-153(11.5x13); JLCPCB Part Class: Extended Part; Datasheet: https://item.szlcsc.com/datasheet/KLM8G1GETF-B041/512098.html; Supplier: LCSC; ConvertToPcb: yes; FootprintName: FBGA-153_L13.0-W11.5-P0.50_KLMAG1JETD-B041; NAND Flash Type: -; Protocol Version: eMMC 5.1; Operating Temperature: -25℃~+85℃; NAND Stand-By Current: -; Controller Stand-By Current: -; Features: 硬件复位功能；ECC纠错功能；内置磨损均衡功能；坏块管理功能；安全写保护功能

## Nets that join several sheets
DRAM_1V35: IMX6ULL_CORE (13 pins), DDR (33 pins)
DRAM_VREF: IMX6ULL_CORE (C19.2 U1.P4), DDR (8 pins)
GND: IMX6ULL_CORE (52 pins), POWER (17 pins), DDR (71 pins)
VCC_5V: IMX6ULL_CORE (JP1.1 JP1.2), POWER (10 pins)
DRAM_ADDR0: IMX6ULL_CORE (U1.L5), DDR (U2.N3)
DRAM_ADDR1: IMX6ULL_CORE (U1.H2), DDR (U2.P7)
DRAM_ADDR2: IMX6ULL_CORE (U1.K1), DDR (U2.P3)
DRAM_ADDR3: IMX6ULL_CORE (U1.M2), DDR (U2.N2)
DRAM_ADDR4: IMX6ULL_CORE (U1.K4), DDR (U2.P8)
DRAM_ADDR5: IMX6ULL_CORE (U1.L1), DDR (U2.P2)
DRAM_ADDR6: IMX6ULL_CORE (U1.G2), DDR (U2.R8)
DRAM_ADDR7: IMX6ULL_CORE (U1.H4), DDR (U2.R2)
DRAM_ADDR8: IMX6ULL_CORE (U1.J4), DDR (U2.T8)
DRAM_ADDR9: IMX6ULL_CORE (U1.L2), DDR (U2.R3)
DRAM_ADDR10: IMX6ULL_CORE (U1.M4), DDR (U2.L7)
DRAM_ADDR11: IMX6ULL_CORE (U1.K3), DDR (U2.R7)
DRAM_ADDR12: IMX6ULL_CORE (U1.L4), DDR (U2.N7)
DRAM_ADDR13: IMX6ULL_CORE (U1.H3), DDR (U2.T3)
DRAM_ADDR14: IMX6ULL_CORE (U1.G1), DDR (U2.T7)
DRAM_ADDR15: IMX6ULL_CORE (U1.K5), DDR (U2.M7)
DRAM_CAS_B: IMX6ULL_CORE (U1.J2), DDR (U2.K3)
DRAM_CS0_B: IMX6ULL_CORE (U1.N2), DDR (U2.L2)
DRAM_CS1_B: IMX6ULL_CORE (U1.H5), DDR (U2.L1)
DRAM_DATA0: IMX6ULL_CORE (U1.T4), DDR (U2.E3)
DRAM_DATA1: IMX6ULL_CORE (U1.U6), DDR (U2.F7)
DRAM_DATA2: IMX6ULL_CORE (U1.T6), DDR (U2.F2)
DRAM_DATA3: IMX6ULL_CORE (U1.U7), DDR (U2.F8)
DRAM_DATA4: IMX6ULL_CORE (U1.U8), DDR (U2.H3)
DRAM_DATA5: IMX6ULL_CORE (U1.T8), DDR (U2.H8)
DRAM_DATA6: IMX6ULL_CORE (U1.T5), DDR (U2.G2)
DRAM_DATA7: IMX6ULL_CORE (U1.U4), DDR (U2.H7)
DRAM_DATA8: IMX6ULL_CORE (U1.U2), DDR (U2.D7)
DRAM_DATA9: IMX6ULL_CORE (U1.U3), DDR (U2.C3)
DRAM_DATA10: IMX6ULL_CORE (U1.U5), DDR (U2.C8)
DRAM_DATA11: IMX6ULL_CORE (U1.R4), DDR (U2.C2)
DRAM_DATA12: IMX6ULL_CORE (U1.P5), DDR (U2.A7)
DRAM_DATA13: IMX6ULL_CORE (U1.P3), DDR (U2.A2)
DRAM_DATA14: IMX6ULL_CORE (U1.R2), DDR (U2.B8)
DRAM_DATA15: IMX6ULL_CORE (U1.R1), DDR (U2.A3)
DRAM_DQM0: IMX6ULL_CORE (U1.T7), DDR (U2.E7)
DRAM_DQM1: IMX6ULL_CORE (U1.T3), DDR (U2.D3)
DRAM_ODT0: IMX6ULL_CORE (U1.N1), DDR (U2.K1)
DRAM_ODT1: IMX6ULL_CORE (U1.F1), DDR (U2.J1)
DRAM_RAS_B: IMX6ULL_CORE (U1.M5), DDR (U2.J3)
DRAM_RESET: IMX6ULL_CORE (R2.1 U1.G4), DDR (U2.T2)
DRAM_SDBA0: IMX6ULL_CORE (U1.M1), DDR (U2.M2)
DRAM_SDBA1: IMX6ULL_CORE (U1.H1), DDR (U2.N8)
DRAM_SDBA2: IMX6ULL_CORE (U1.K2), DDR (U2.M3)
DRAM_SDCKE0: IMX6ULL_CORE (R3.2 U1.M3), DDR (U2.K9)
DRAM_SDCKE1: IMX6ULL_CORE (R1.2 U1.J3), DDR (U2.J9)
DRAM_SDCLK0_N: IMX6ULL_CORE (U1.P2), DDR (R5.2 U2.K7)
DRAM_SDCLK0_P: IMX6ULL_CORE (U1.P1), DDR (R5.1 U2.J7)
DRAM_SDQS0_N: IMX6ULL_CORE (U1.P7), DDR (C48.1 C50.1 U2.G3)
DRAM_SDQS0_P: IMX6ULL_CORE (U1.P6), DDR (C48.2 C50.2 U2.F3)
DRAM_SDQS1_N: IMX6ULL_CORE (U1.T2), DDR (C47.2 C49.2 U2.B7)
DRAM_SDQS1_P: IMX6ULL_CORE (U1.T1), DDR (C47.1 C49.1 U2.C7)
DRAM_SDWE_B: IMX6ULL_CORE (U1.J1), DDR (U2.L3)